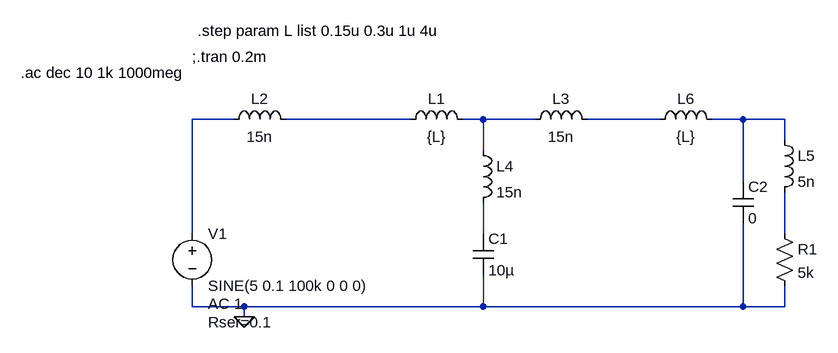
[diagram p0: schematic ferrite_bead.asc]
ferrite_bead.asc, the LTspice schematic file:
Version 4
SHEET 1 884 680
WIRE -32 112 -96 112
WIRE 240 112 48 112
WIRE 352 112 320 112
WIRE 432 112 352 112
WIRE 624 112 512 112
WIRE 752 112 704 112
WIRE 816 112 752 112
WIRE 816 144 816 112
WIRE 352 160 352 112
WIRE 752 208 752 112
WIRE -96 288 -96 112
WIRE 352 288 352 240
WIRE 816 288 816 224
WIRE -96 400 -96 368
WIRE -16 400 -96 400
WIRE 352 400 352 352
WIRE 352 400 -16 400
WIRE 752 400 752 272
WIRE 752 400 352 400
WIRE 816 400 816 368
WIRE 816 400 752 400
WIRE -16 416 -16 400
FLAG -16 416 0
SYMBOL ind 224 128 R270
WINDOW 0 32 56 VTop 2
WINDOW 3 5 56 VBottom 2
SYMATTR InstName L1
SYMATTR Value {L}
SYMATTR SpiceLine Rser=0.8
SYMBOL cap 336 288 R0
SYMATTR InstName C1
SYMATTR Value 10µ
SYMATTR SpiceLine V=10 Irms=8.97 Rser=0.00641498 Lser=0
SYMBOL res 800 272 R0
SYMATTR InstName R1
SYMATTR Value 5k
SYMBOL voltage -96 272 R0
WINDOW 123 24 124 Left 2
WINDOW 39 24 152 Left 2
SYMATTR Value2 AC 1
SYMATTR SpiceLine Rser=0.1
SYMATTR InstName V1
SYMATTR Value SINE(5 0.1 100k 0 0 0)
SYMBOL ind -48 128 R270
WINDOW 0 32 56 VTop 2
WINDOW 3 5 56 VBottom 2
SYMATTR InstName L2
SYMATTR Value 15n
SYMBOL ind 416 128 R270
WINDOW 0 32 56 VTop 2
WINDOW 3 5 56 VBottom 2
SYMATTR InstName L3
SYMATTR Value 15n
SYMBOL ind 336 144 R0
SYMATTR InstName L4
SYMATTR Value 15n
SYMBOL ind 800 128 R0
SYMATTR InstName L5
SYMATTR Value 5n
SYMBOL ind 608 128 R270
WINDOW 0 32 56 VTop 2
WINDOW 3 5 56 VBottom 2
SYMATTR InstName L6
SYMATTR Value {L}
SYMATTR SpiceLine Rser=0.8
SYMBOL cap 736 208 R0
SYMATTR InstName C2
SYMATTR Value 0
TEXT -96 16 Left 2 !;.tran 0.2m
TEXT -88 -24 Left 2 !.step param L list 0.15u 0.3u 1u 4u
TEXT -360 40 Left 2 !.ac dec 10 1k 1000meg

The netlist it stands for:
* ferrite_bead.asc
L1 N002 N003 {L} Rser=0.8
C1 N006 0 10µ V=10 Irms=8.97 Rser=0.00641498 Lser=0
R1 N007 0 5k
V1 N001 0 SINE(5 0.1 100k 0 0 0) AC 1 Rser=0.1
L2 N001 N002 15n
L3 N003 N004 15n
L4 N003 N006 15n
L5 N005 N007 5n
L6 N004 N005 {L} Rser=0.8
C2 N005 0 0
;.tran 0.2m
.step param L list 0.15u 0.3u 1u 4u
.ac dec 10 1k 1000meg
.backanno
.end